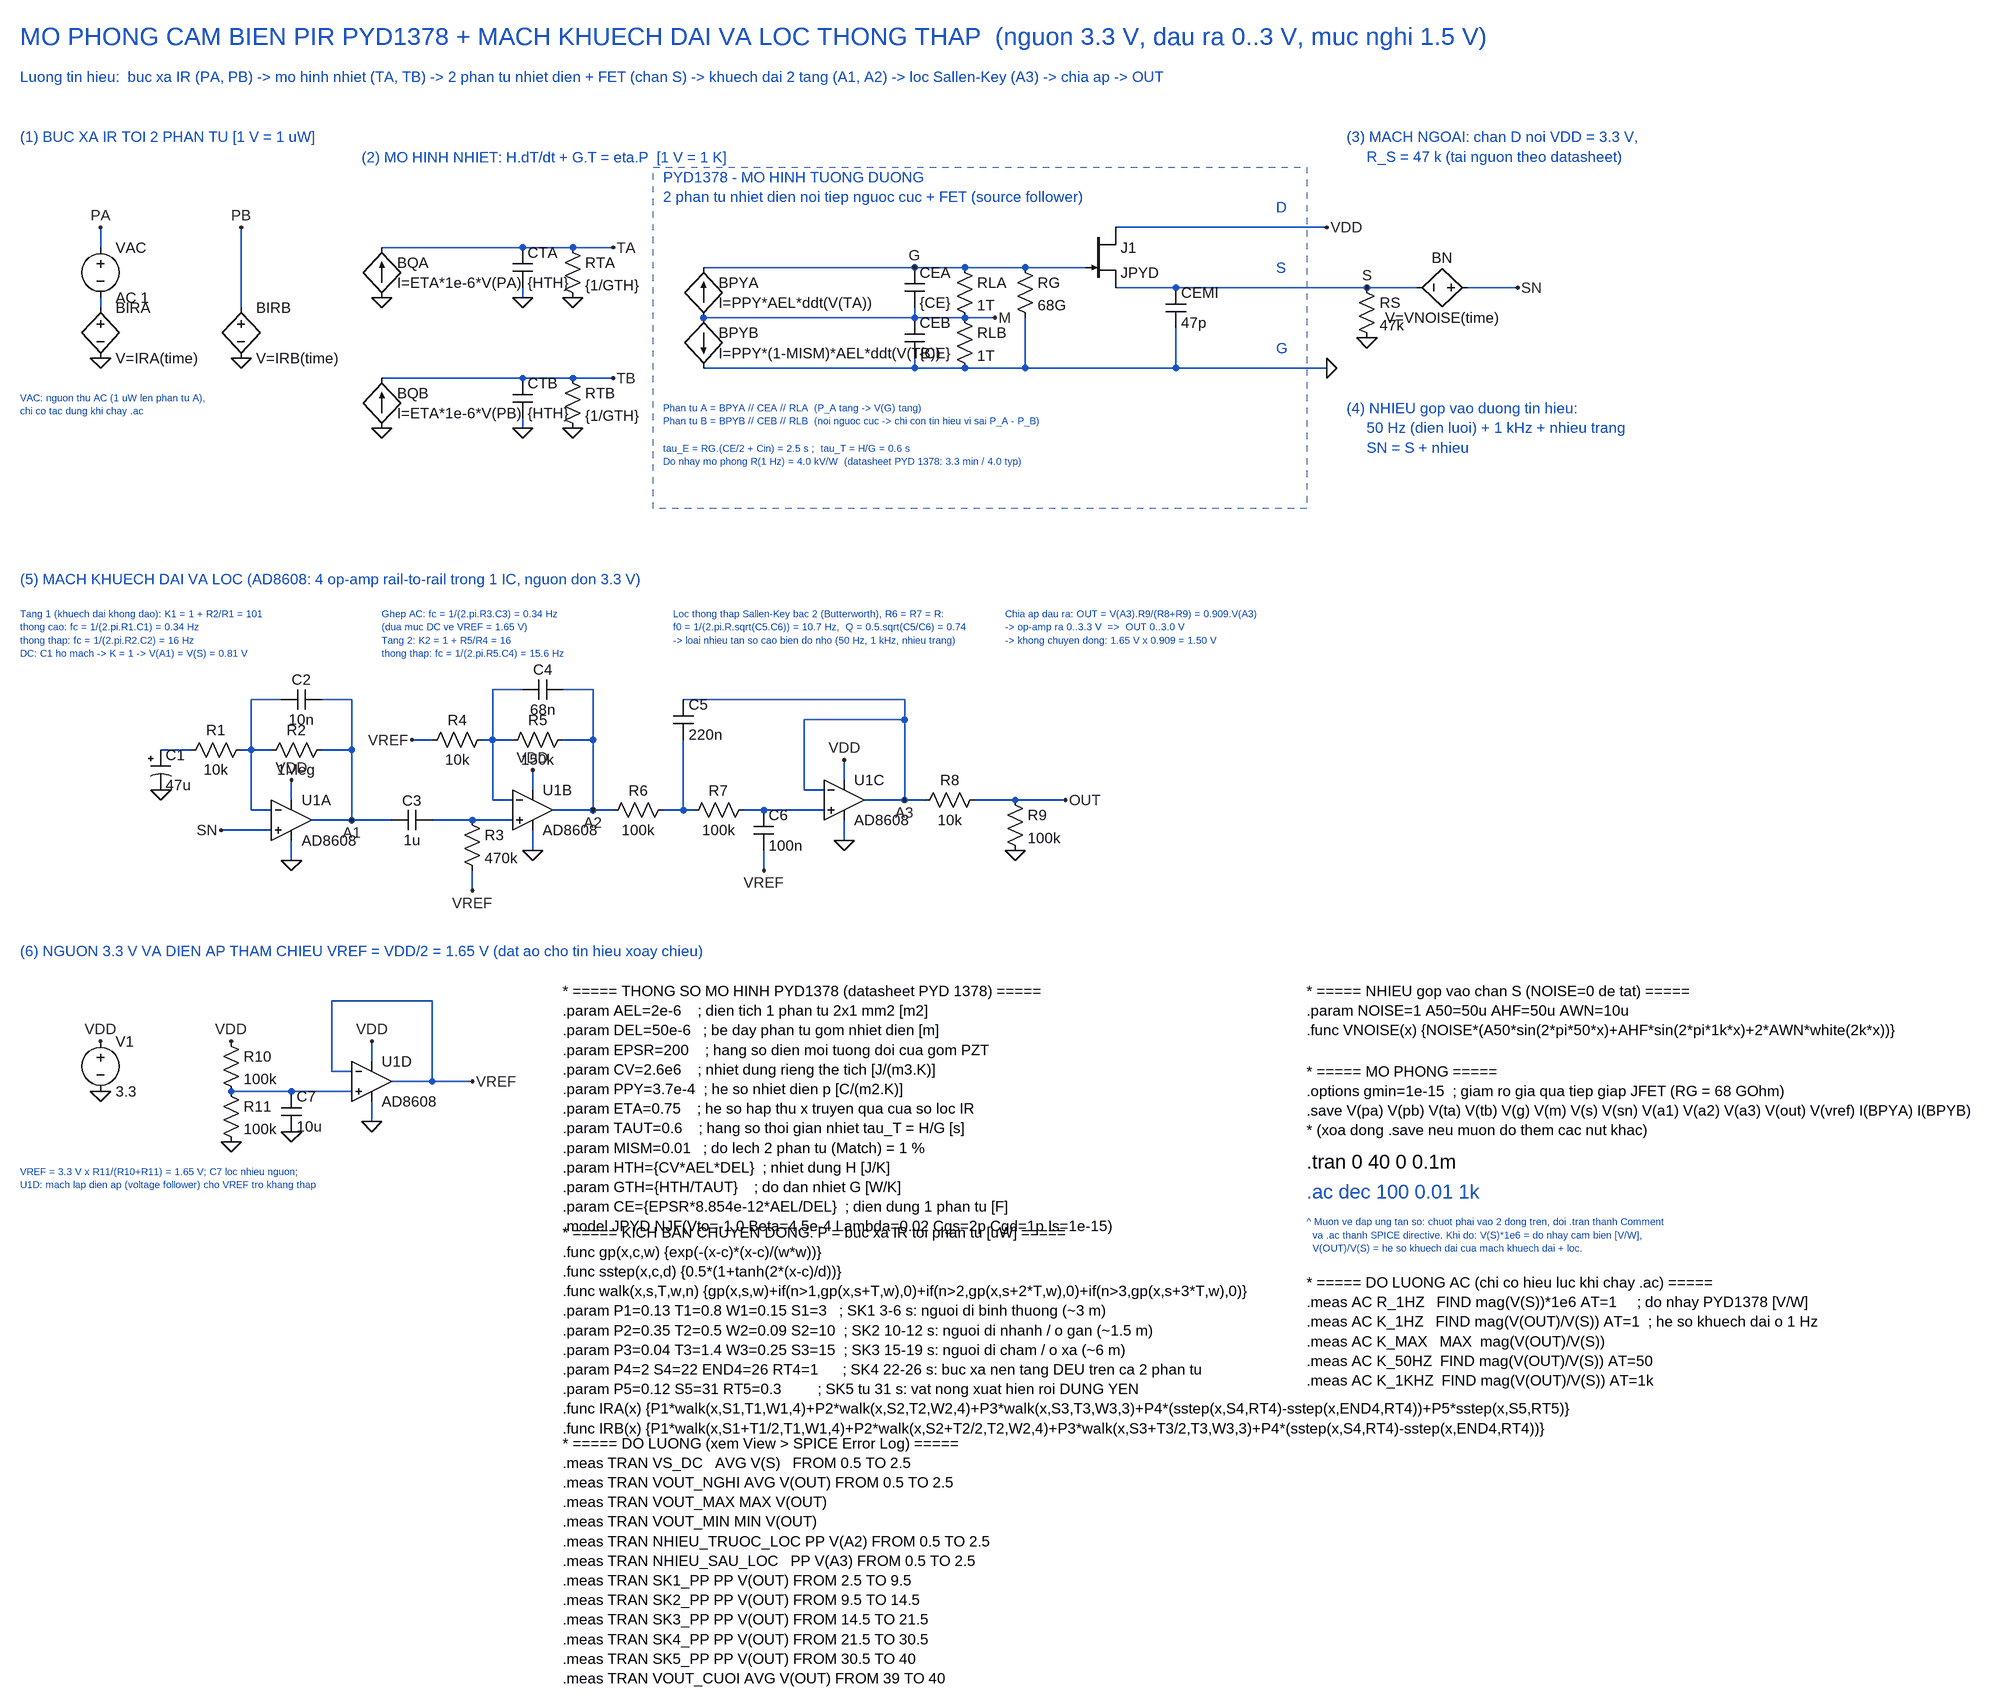
[diagram p0: schematic PIR_PYD1378.asc]
PIR_PYD1378.asc, the LTspice schematic file:
Version 4
SHEET 1 3400 2400
WIRE 96 112 96 128
WIRE 96 32 96 0
WIRE 320 128 320 0
WIRE 544 32 768 32
WIRE 768 32 848 32
WIRE 848 32 912 32
WIRE 768 96 768 112
WIRE 544 240 768 240
WIRE 768 240 848 240
WIRE 848 240 912 240
WIRE 768 304 768 320
WIRE 1056 64 1392 64
WIRE 1392 64 1472 64
WIRE 1472 64 1568 64
WIRE 1568 64 1664 64
WIRE 1392 128 1392 144
WIRE 1056 144 1392 144
WIRE 1392 144 1472 144
WIRE 1472 144 1520 144
WIRE 1392 208 1392 224
WIRE 1568 144 1568 224
WIRE 1808 160 1808 224
WIRE 1056 224 1392 224
WIRE 1392 224 1472 224
WIRE 1472 224 1568 224
WIRE 1568 224 1808 224
WIRE 1808 224 2048 224
WIRE 1712 0 2048 0
WIRE 1712 96 1808 96
WIRE 1808 96 2048 96
WIRE 2048 96 2112 96
WIRE 2112 96 2192 96
WIRE 2272 96 2352 96
WIRE 400 912 400 880
WIRE 400 976 400 1008
WIRE 368 960 288 960
WIRE 368 928 336 928
WIRE 336 928 336 832
WIRE 320 832 336 832
WIRE 336 832 368 832
WIRE 336 832 336 752
WIRE 336 752 384 752
WIRE 448 832 496 832
WIRE 448 752 496 752
WIRE 496 752 496 832
WIRE 496 832 496 944
WIRE 432 944 496 944
WIRE 240 832 192 832
WIRE 784 896 784 864
WIRE 784 960 784 992
WIRE 496 944 560 944
WIRE 624 944 688 944
WIRE 688 944 752 944
WIRE 688 1024 688 1056
WIRE 752 912 720 912
WIRE 720 912 720 816
WIRE 704 816 720 816
WIRE 720 816 752 816
WIRE 720 816 720 736
WIRE 720 736 768 736
WIRE 832 816 880 816
WIRE 832 736 880 736
WIRE 880 736 880 816
WIRE 880 816 880 928
WIRE 816 928 880 928
WIRE 624 816 592 816
WIRE 1280 880 1280 848
WIRE 1280 944 1280 976
WIRE 880 928 912 928
WIRE 992 928 1024 928
WIRE 1024 928 1040 928
WIRE 1120 928 1152 928
WIRE 1152 928 1248 928
WIRE 1024 816 1024 928
WIRE 1152 992 1152 1024
WIRE 1024 752 1376 752
WIRE 1376 752 1376 784
WIRE 1376 784 1376 912
WIRE 1248 896 1216 896
WIRE 1216 896 1216 784
WIRE 1216 784 1376 784
WIRE 1312 912 1376 912
WIRE 1376 912 1408 912
WIRE 1488 912 1552 912
WIRE 1552 912 1632 912
WIRE 304 1376 400 1376
WIRE 400 1376 496 1376
WIRE 528 1328 528 1296
WIRE 528 1392 528 1424
WIRE 496 1344 464 1344
WIRE 464 1344 464 1232
WIRE 464 1232 624 1232
WIRE 624 1232 624 1360
WIRE 560 1360 624 1360
WIRE 624 1360 688 1360
FLAG 96 0 PA
FLAG 96 208 0
FLAG 320 0 PB
FLAG 320 208 0
FLAG 912 32 TA
FLAG 544 112 0
FLAG 768 112 0
FLAG 848 112 0
FLAG 912 240 TB
FLAG 544 320 0
FLAG 768 320 0
FLAG 848 320 0
FLAG 1392 64 G
FLAG 1520 144 M
FLAG 2048 0 VDD
FLAG 2048 224 0
FLAG 2112 176 0
FLAG 2112 96 S
FLAG 2352 96 SN
FLAG 400 880 VDD
FLAG 400 1008 0
FLAG 288 960 SN
FLAG 192 896 0
FLAG 496 944 A1
FLAG 784 864 VDD
FLAG 784 992 0
FLAG 688 1056 VREF
FLAG 592 816 VREF
FLAG 880 928 A2
FLAG 1280 848 VDD
FLAG 1280 976 0
FLAG 1152 1024 VREF
FLAG 1376 912 A3
FLAG 1552 992 0
FLAG 1632 912 OUT
FLAG 96 1296 VDD
FLAG 96 1376 0
FLAG 304 1296 VDD
FLAG 304 1456 0
FLAG 400 1440 0
FLAG 528 1296 VDD
FLAG 528 1424 0
FLAG 688 1360 VREF
SYMBOL voltage 96 16 R0
SYMATTR InstName VAC
SYMATTR Value AC 1
SYMBOL bv 96 112 R0
SYMATTR InstName BIRA
SYMATTR Value V=IRA(time)
SYMBOL bv 320 112 R0
SYMATTR InstName BIRB
SYMATTR Value V=IRB(time)
SYMBOL bi2 544 32 R0
WINDOW 0 24 24 Left 2
WINDOW 3 24 56 Left 2
SYMATTR InstName BQA
SYMATTR Value I=ETA*1e-6*V(PA)
SYMBOL cap 752 32 R0
SYMATTR InstName CTA
SYMATTR Value {HTH}
SYMBOL res 832 16 R0
SYMATTR InstName RTA
SYMATTR Value {1/GTH}
SYMBOL bi2 544 240 R0
WINDOW 0 24 24 Left 2
WINDOW 3 24 56 Left 2
SYMATTR InstName BQB
SYMATTR Value I=ETA*1e-6*V(PB)
SYMBOL cap 752 240 R0
SYMATTR InstName CTB
SYMATTR Value {HTH}
SYMBOL res 832 224 R0
SYMATTR InstName RTB
SYMATTR Value {1/GTH}
SYMBOL bi2 1056 64 R0
WINDOW 0 24 24 Left 2
WINDOW 3 24 56 Left 2
SYMATTR InstName BPYA
SYMATTR Value I=PPY*AEL*ddt(V(TA))
SYMBOL bi 1056 144 R0
WINDOW 0 24 24 Left 2
WINDOW 3 24 56 Left 2
SYMATTR InstName BPYB
SYMATTR Value I=PPY*(1-MISM)*AEL*ddt(V(TB))
SYMBOL cap 1376 64 R0
SYMATTR InstName CEA
SYMATTR Value {CE}
SYMBOL cap 1376 144 R0
SYMATTR InstName CEB
SYMATTR Value {CE}
SYMBOL res 1456 48 R0
SYMATTR InstName RLA
SYMATTR Value 1T
SYMBOL res 1456 128 R0
SYMATTR InstName RLB
SYMATTR Value 1T
SYMBOL res 1552 48 R0
SYMATTR InstName RG
SYMATTR Value 68G
SYMBOL njf 1664 0 R0
SYMATTR InstName J1
SYMATTR Value JPYD
SYMBOL cap 1792 96 R0
SYMATTR InstName CEMI
SYMATTR Value 47p
SYMBOL res 2096 80 R0
SYMATTR InstName RS
SYMATTR Value 47k
SYMBOL bv 2288 96 R90
WINDOW 0 -32 56 VBottom 2
WINDOW 3 32 56 VTop 2
SYMATTR InstName BN
SYMATTR Value V=VNOISE(time)
SYMBOL OpAmps\AD8608 400 880 R0
SYMATTR InstName U1A
SYMATTR Value AD8608
SYMBOL res 464 816 R90
WINDOW 0 0 56 VBottom 2
WINDOW 3 32 56 VTop 2
SYMATTR InstName R2
SYMATTR Value 1Meg
SYMBOL cap 448 736 R90
WINDOW 0 0 32 VBottom 2
WINDOW 3 32 32 VTop 2
SYMATTR InstName C2
SYMATTR Value 10n
SYMBOL res 336 816 R90
WINDOW 0 0 56 VBottom 2
WINDOW 3 32 56 VTop 2
SYMATTR InstName R1
SYMATTR Value 10k
SYMBOL polcap 176 832 R0
SYMATTR InstName C1
SYMATTR Value 47u
SYMBOL cap 624 928 R90
WINDOW 0 0 32 VBottom 2
WINDOW 3 32 32 VTop 2
SYMATTR InstName C3
SYMATTR Value 1u
SYMBOL res 672 928 R0
SYMATTR InstName R3
SYMATTR Value 470k
SYMBOL OpAmps\AD8608 784 864 R0
SYMATTR InstName U1B
SYMATTR Value AD8608
SYMBOL res 848 800 R90
WINDOW 0 0 56 VBottom 2
WINDOW 3 32 56 VTop 2
SYMATTR InstName R5
SYMATTR Value 150k
SYMBOL cap 832 720 R90
WINDOW 0 0 32 VBottom 2
WINDOW 3 32 32 VTop 2
SYMATTR InstName C4
SYMATTR Value 68n
SYMBOL res 720 800 R90
WINDOW 0 0 56 VBottom 2
WINDOW 3 32 56 VTop 2
SYMATTR InstName R4
SYMATTR Value 10k
SYMBOL OpAmps\AD8608 1280 848 R0
SYMATTR InstName U1C
SYMATTR Value AD8608
SYMBOL res 1008 912 R90
WINDOW 0 0 56 VBottom 2
WINDOW 3 32 56 VTop 2
SYMATTR InstName R6
SYMATTR Value 100k
SYMBOL res 1136 912 R90
WINDOW 0 0 56 VBottom 2
WINDOW 3 32 56 VTop 2
SYMATTR InstName R7
SYMATTR Value 100k
SYMBOL cap 1008 752 R0
SYMATTR InstName C5
SYMATTR Value 220n
SYMBOL cap 1136 928 R0
SYMATTR InstName C6
SYMATTR Value 100n
SYMBOL res 1504 896 R90
WINDOW 0 0 56 VBottom 2
WINDOW 3 32 56 VTop 2
SYMATTR InstName R8
SYMATTR Value 10k
SYMBOL res 1536 896 R0
SYMATTR InstName R9
SYMATTR Value 100k
SYMBOL voltage 96 1280 R0
SYMATTR InstName V1
SYMATTR Value 3.3
SYMBOL res 288 1280 R0
SYMATTR InstName R10
SYMATTR Value 100k
SYMBOL res 288 1360 R0
SYMATTR InstName R11
SYMATTR Value 100k
SYMBOL cap 384 1376 R0
SYMATTR InstName C7
SYMATTR Value 10u
SYMBOL OpAmps\AD8608 528 1296 R0
SYMATTR InstName U1D
SYMATTR Value AD8608
RECTANGLE Normal 976 -96 2016 448 2
TEXT -32 -304 Left 4 ;MO PHONG CAM BIEN PIR PYD1378 + MACH KHUECH DAI VA LOC THONG THAP  (nguon 3.3 V, dau ra 0..3 V, muc nghi 1.5 V)
TEXT -32 -240 Left 2 ;Luong tin hieu:  buc xa IR (PA, PB) -> mo hinh nhiet (TA, TB) -> 2 phan tu nhiet dien + FET (chan S) -> khuech dai 2 tang (A1, A2) -> loc Sallen-Key (A3) -> chia ap -> OUT
TEXT -32 -144 Left 2 ;(1) BUC XA IR TOI 2 PHAN TU [1 V = 1 uW]
TEXT -32 272 Left 1 ;VAC: nguon thu AC (1 uW len phan tu A),\nchi co tac dung khi chay .ac
TEXT 512 -112 Left 2 ;(2) MO HINH NHIET: H.dT/dt + G.T = eta.P  [1 V = 1 K]
TEXT 992 -80 Left 2 ;PYD1378 - MO HINH TUONG DUONG\n2 phan tu nhiet dien noi tiep nguoc cuc + FET (source follower)
TEXT 1968 -32 Left 2 ;D
TEXT 1968 64 Left 2 ;S
TEXT 1968 192 Left 2 ;G
TEXT 992 288 Left 1 ;Phan tu A = BPYA // CEA // RLA  (P_A tang -> V(G) tang)\nPhan tu B = BPYB // CEB // RLB  (noi nguoc cuc -> chi con tin hieu vi sai P_A - P_B)
TEXT 992 352 Left 1 ;tau_E = RG.(CE/2 + Cin) = 2.5 s ;  tau_T = H/G = 0.6 s\nDo nhay mo phong R(1 Hz) = 4.0 kV/W  (datasheet PYD 1378: 3.3 min / 4.0 typ)
TEXT 2080 -144 Left 2 ;(3) MACH NGOAI: chan D noi VDD = 3.3 V,\n     R_S = 47 k (tai nguon theo datasheet)
TEXT 2080 288 Left 2 ;(4) NHIEU gop vao duong tin hieu:\n     50 Hz (dien luoi) + 1 kHz + nhieu trang\n     SN = S + nhieu
TEXT -32 560 Left 2 ;(5) MACH KHUECH DAI VA LOC (AD8608: 4 op-amp rail-to-rail trong 1 IC, nguon don 3.3 V)
TEXT -32 616 Left 1 ;Tang 1 (khuech dai khong dao): K1 = 1 + R2/R1 = 101\nthong cao: fc = 1/(2.pi.R1.C1) = 0.34 Hz\nthong thap: fc = 1/(2.pi.R2.C2) = 16 Hz\nDC: C1 ho mach -> K = 1 -> V(A1) = V(S) = 0.81 V
TEXT 544 616 Left 1 ;Ghep AC: fc = 1/(2.pi.R3.C3) = 0.34 Hz\n(dua muc DC ve VREF = 1.65 V)\nTang 2: K2 = 1 + R5/R4 = 16\nthong thap: fc = 1/(2.pi.R5.C4) = 15.6 Hz
TEXT 1008 616 Left 1 ;Loc thong thap Sallen-Key bac 2 (Butterworth), R6 = R7 = R:\nf0 = 1/(2.pi.R.sqrt(C5.C6)) = 10.7 Hz,  Q = 0.5.sqrt(C5/C6) = 0.74\n-> loai nhieu tan so cao bien do nho (50 Hz, 1 kHz, nhieu trang)
TEXT 1536 616 Left 1 ;Chia ap dau ra: OUT = V(A3).R9/(R8+R9) = 0.909.V(A3)\n-> op-amp ra 0..3.3 V  =>  OUT 0..3.0 V\n-> khong chuyen dong: 1.65 V x 0.909 = 1.50 V
TEXT -32 1152 Left 2 ;(6) NGUON 3.3 V VA DIEN AP THAM CHIEU VREF = VDD/2 = 1.65 V (dat ao cho tin hieu xoay chieu)
TEXT -32 1504 Left 1 ;VREF = 3.3 V x R11/(R10+R11) = 1.65 V; C7 loc nhieu nguon;\nU1D: mach lap dien ap (voltage follower) cho VREF tro khang thap
TEXT 832 1216 Left 2 !* ===== THONG SO MO HINH PYD1378 (datasheet PYD 1378) =====\n.param AEL=2e-6    ; dien tich 1 phan tu 2x1 mm2 [m2]\n.param DEL=50e-6   ; be day phan tu gom nhiet dien [m]\n.param EPSR=200    ; hang so dien moi tuong doi cua gom PZT\n.param CV=2.6e6    ; nhiet dung rieng the tich [J/(m3.K)]\n.param PPY=3.7e-4  ; he so nhiet dien p [C/(m2.K)]\n.param ETA=0.75    ; he so hap thu x truyen qua cua so loc IR\n.param TAUT=0.6    ; hang so thoi gian nhiet tau_T = H/G [s]\n.param MISM=0.01   ; do lech 2 phan tu (Match) = 1 %\n.param HTH={CV*AEL*DEL}  ; nhiet dung H [J/K]\n.param GTH={HTH/TAUT}    ; do dan nhiet G [W/K]\n.param CE={EPSR*8.854e-12*AEL/DEL}  ; dien dung 1 phan tu [F]\n.model JPYD NJF(Vto=-1.0 Beta=4.5e-4 Lambda=0.02 Cgs=2p Cgd=1p Is=1e-15)
TEXT 832 1600 Left 2 !* ===== KICH BAN CHUYEN DONG: P = buc xa IR toi phan tu [uW] =====\n.func gp(x,c,w) {exp(-(x-c)*(x-c)/(w*w))}\n.func sstep(x,c,d) {0.5*(1+tanh(2*(x-c)/d))}\n.func walk(x,s,T,w,n) {gp(x,s,w)+if(n>1,gp(x,s+T,w),0)+if(n>2,gp(x,s+2*T,w),0)+if(n>3,gp(x,s+3*T,w),0)}\n.param P1=0.13 T1=0.8 W1=0.15 S1=3   ; SK1 3-6 s: nguoi di binh thuong (~3 m)\n.param P2=0.35 T2=0.5 W2=0.09 S2=10  ; SK2 10-12 s: nguoi di nhanh / o gan (~1.5 m)\n.param P3=0.04 T3=1.4 W3=0.25 S3=15  ; SK3 15-19 s: nguoi di cham / o xa (~6 m)\n.param P4=2 S4=22 END4=26 RT4=1      ; SK4 22-26 s: buc xa nen tang DEU tren ca 2 phan tu\n.param P5=0.12 S5=31 RT5=0.3         ; SK5 tu 31 s: vat nong xuat hien roi DUNG YEN\n.func IRA(x) {P1*walk(x,S1,T1,W1,4)+P2*walk(x,S2,T2,W2,4)+P3*walk(x,S3,T3,W3,3)+P4*(sstep(x,S4,RT4)-sstep(x,END4,RT4))+P5*sstep(x,S5,RT5)}\n.func IRB(x) {P1*walk(x,S1+T1/2,T1,W1,4)+P2*walk(x,S2+T2/2,T2,W2,4)+P3*walk(x,S3+T3/2,T3,W3,3)+P4*(sstep(x,S4,RT4)-sstep(x,END4,RT4))}
TEXT 2016 1216 Left 2 !* ===== NHIEU gop vao chan S (NOISE=0 de tat) =====\n.param NOISE=1 A50=50u AHF=50u AWN=10u\n.func VNOISE(x) {NOISE*(A50*sin(2*pi*50*x)+AHF*sin(2*pi*1k*x)+2*AWN*white(2k*x))}
TEXT 2016 1344 Left 2 !* ===== MO PHONG =====\n.options gmin=1e-15  ; giam ro gia qua tiep giap JFET (RG = 68 GOhm)\n.save V(pa) V(pb) V(ta) V(tb) V(g) V(m) V(s) V(sn) V(a1) V(a2) V(a3) V(out) V(vref) I(BPYA) I(BPYB)\n* (xoa dong .save neu muon do them cac nut khac)
TEXT 2016 1488 Left 3 !.tran 0 40 0 0.1m
TEXT 2016 1536 Left 3 ;.ac dec 100 0.01 1k
TEXT 2016 1584 Left 1 ;^ Muon ve dap ung tan so: chuot phai vao 2 dong tren, doi .tran thanh Comment\n  va .ac thanh SPICE directive. Khi do: V(S)*1e6 = do nhay cam bien [V/W],\n  V(OUT)/V(S) = he so khuech dai cua mach khuech dai + loc.
TEXT 2016 1680 Left 2 !* ===== DO LUONG AC (chi co hieu luc khi chay .ac) =====\n.meas AC R_1HZ   FIND mag(V(S))*1e6 AT=1     ; do nhay PYD1378 [V/W]\n.meas AC K_1HZ   FIND mag(V(OUT)/V(S)) AT=1  ; he so khuech dai o 1 Hz\n.meas AC K_MAX   MAX  mag(V(OUT)/V(S))\n.meas AC K_50HZ  FIND mag(V(OUT)/V(S)) AT=50\n.meas AC K_1KHZ  FIND mag(V(OUT)/V(S)) AT=1k
TEXT 832 1936 Left 2 !* ===== DO LUONG (xem View > SPICE Error Log) =====\n.meas TRAN VS_DC   AVG V(S)   FROM 0.5 TO 2.5\n.meas TRAN VOUT_NGHI AVG V(OUT) FROM 0.5 TO 2.5\n.meas TRAN VOUT_MAX MAX V(OUT)\n.meas TRAN VOUT_MIN MIN V(OUT)\n.meas TRAN NHIEU_TRUOC_LOC PP V(A2) FROM 0.5 TO 2.5\n.meas TRAN NHIEU_SAU_LOC   PP V(A3) FROM 0.5 TO 2.5\n.meas TRAN SK1_PP PP V(OUT) FROM 2.5 TO 9.5\n.meas TRAN SK2_PP PP V(OUT) FROM 9.5 TO 14.5\n.meas TRAN SK3_PP PP V(OUT) FROM 14.5 TO 21.5\n.meas TRAN SK4_PP PP V(OUT) FROM 21.5 TO 30.5\n.meas TRAN SK5_PP PP V(OUT) FROM 30.5 TO 40\n.meas TRAN VOUT_CUOI AVG V(OUT) FROM 39 TO 40

The netlist it stands for:
* PIR_PYD1378.asc
VAC PA N001 AC 1
BIRA N001 0 V=IRA(time)
BIRB PB 0 V=IRB(time)
BQA 0 TA I=ETA*1e-6*V(PA)
CTA TA 0 {HTH}
RTA TA 0 {1/GTH}
BQB 0 TB I=ETA*1e-6*V(PB)
CTB TB 0 {HTH}
RTB TB 0 {1/GTH}
BPYA M G I=PPY*AEL*ddt(V(TA))
BPYB M 0 I=PPY*(1-MISM)*AEL*ddt(V(TB))
CEA G M {CE}
CEB M 0 {CE}
RLA G M 1T
RLB M 0 1T
RG G 0 68G
J1 VDD G S JPYD
CEMI S 0 47p
RS S 0 47k
BN SN S V=VNOISE(time)
XU1A SN N002 VDD 0 A1 AD8608  ; pins In+ In- V+ V- OUT
R2 A1 N002 1Meg
C2 A1 N002 10n
R1 N002 N003 10k
C1 N003 0 47u
C3 N004 A1 1u
R3 N004 VREF 470k
XU1B N004 N005 VDD 0 A2 AD8608  ; pins In+ In- V+ V- OUT
R5 A2 N005 150k
C4 A2 N005 68n
R4 N005 VREF 10k
XU1C N007 A3 VDD 0 A3 AD8608  ; pins In+ In- V+ V- OUT
R6 N006 A2 100k
R7 N007 N006 100k
C5 A3 N006 220n
C6 N007 VREF 100n
R8 OUT A3 10k
R9 OUT 0 100k
V1 VDD 0 3.3
R10 VDD N008 100k
R11 N008 0 100k
C7 N008 0 10u
XU1D N008 VREF VDD 0 VREF AD8608  ; pins In+ In- V+ V- OUT
.model NJF NJF
.model PJF PJF
.lib standard.jft
* MO PHONG CAM BIEN PIR PYD1378 + MACH KHUECH DAI VA LOC THONG THAP  (nguon 3.3 V, dau ra 0..3 V, muc nghi 1.5 V)
* Luong tin hieu:  buc xa IR (PA, PB) -> mo hinh nhiet (TA, TB) -> 2 phan tu nhiet dien + FET (chan S) -> khuech dai 2 tang (A1, A2) -> loc Sallen-Key (A3) -> chia ap -> OUT
* (1) BUC XA IR TOI 2 PHAN TU [1 V = 1 uW]
* VAC: nguon thu AC (1 uW len phan tu A),
* chi co tac dung khi chay .ac
* (2) MO HINH NHIET: H.dT/dt + G.T = eta.P  [1 V = 1 K]
* PYD1378 - MO HINH TUONG DUONG
* 2 phan tu nhiet dien noi tiep nguoc cuc + FET (source follower)
* D
* S
* G
* Phan tu A = BPYA // CEA // RLA  (P_A tang -> V(G) tang)
* Phan tu B = BPYB // CEB // RLB  (noi nguoc cuc -> chi con tin hieu vi sai P_A - P_B)
* tau_E = RG.(CE/2 + Cin) = 2.5 s ;  tau_T = H/G = 0.6 s
* Do nhay mo phong R(1 Hz) = 4.0 kV/W  (datasheet PYD 1378: 3.3 min / 4.0 typ)
* (3) MACH NGOAI: chan D noi VDD = 3.3 V,
*      R_S = 47 k (tai nguon theo datasheet)
* (4) NHIEU gop vao duong tin hieu:
*      50 Hz (dien luoi) + 1 kHz + nhieu trang
*      SN = S + nhieu
* (5) MACH KHUECH DAI VA LOC (AD8608: 4 op-amp rail-to-rail trong 1 IC, nguon don 3.3 V)
* Tang 1 (khuech dai khong dao): K1 = 1 + R2/R1 = 101
* thong cao: fc = 1/(2.pi.R1.C1) = 0.34 Hz
* thong thap: fc = 1/(2.pi.R2.C2) = 16 Hz
* DC: C1 ho mach -> K = 1 -> V(A1) = V(S) = 0.81 V
* Ghep AC: fc = 1/(2.pi.R3.C3) = 0.34 Hz
* (dua muc DC ve VREF = 1.65 V)
* Tang 2: K2 = 1 + R5/R4 = 16
* thong thap: fc = 1/(2.pi.R5.C4) = 15.6 Hz
* Loc thong thap Sallen-Key bac 2 (Butterworth), R6 = R7 = R:
* f0 = 1/(2.pi.R.sqrt(C5.C6)) = 10.7 Hz,  Q = 0.5.sqrt(C5/C6) = 0.74
* -> loai nhieu tan so cao bien do nho (50 Hz, 1 kHz, nhieu trang)
* Chia ap dau ra: OUT = V(A3).R9/(R8+R9) = 0.909.V(A3)
* -> op-amp ra 0..3.3 V  =>  OUT 0..3.0 V
* -> khong chuyen dong: 1.65 V x 0.909 = 1.50 V
* (6) NGUON 3.3 V VA DIEN AP THAM CHIEU VREF = VDD/2 = 1.65 V (dat ao cho tin hieu xoay chieu)
* VREF = 3.3 V x R11/(R10+R11) = 1.65 V; C7 loc nhieu nguon;
* U1D: mach lap dien ap (voltage follower) cho VREF tro khang thap
* ===== THONG SO MO HINH PYD1378 (datasheet PYD 1378) =====
.param AEL=2e-6    ; dien tich 1 phan tu 2x1 mm2 [m2]
.param DEL=50e-6   ; be day phan tu gom nhiet dien [m]
.param EPSR=200    ; hang so dien moi tuong doi cua gom PZT
.param CV=2.6e6    ; nhiet dung rieng the tich [J/(m3.K)]
.param PPY=3.7e-4  ; he so nhiet dien p [C/(m2.K)]
.param ETA=0.75    ; he so hap thu x truyen qua cua so loc IR
.param TAUT=0.6    ; hang so thoi gian nhiet tau_T = H/G [s]
.param MISM=0.01   ; do lech 2 phan tu (Match) = 1 %
.param HTH={CV*AEL*DEL}  ; nhiet dung H [J/K]
.param GTH={HTH/TAUT}    ; do dan nhiet G [W/K]
.param CE={EPSR*8.854e-12*AEL/DEL}  ; dien dung 1 phan tu [F]
.model JPYD NJF(Vto=-1.0 Beta=4.5e-4 Lambda=0.02 Cgs=2p Cgd=1p Is=1e-15)
* ===== KICH BAN CHUYEN DONG: P = buc xa IR toi phan tu [uW] =====
.func gp(x,c,w) {exp(-(x-c)*(x-c)/(w*w))}
.func sstep(x,c,d) {0.5*(1+tanh(2*(x-c)/d))}
.func walk(x,s,T,w,n) {gp(x,s,w)+if(n>1,gp(x,s+T,w),0)+if(n>2,gp(x,s+2*T,w),0)+if(n>3,gp(x,s+3*T,w),0)}
.param P1=0.13 T1=0.8 W1=0.15 S1=3   ; SK1 3-6 s: nguoi di binh thuong (~3 m)
.param P2=0.35 T2=0.5 W2=0.09 S2=10  ; SK2 10-12 s: nguoi di nhanh / o gan (~1.5 m)
.param P3=0.04 T3=1.4 W3=0.25 S3=15  ; SK3 15-19 s: nguoi di cham / o xa (~6 m)
.param P4=2 S4=22 END4=26 RT4=1      ; SK4 22-26 s: buc xa nen tang DEU tren ca 2 phan tu
.param P5=0.12 S5=31 RT5=0.3         ; SK5 tu 31 s: vat nong xuat hien roi DUNG YEN
.func IRA(x) {P1*walk(x,S1,T1,W1,4)+P2*walk(x,S2,T2,W2,4)+P3*walk(x,S3,T3,W3,3)+P4*(sstep(x,S4,RT4)-sstep(x,END4,RT4))+P5*sstep(x,S5,RT5)}
.func IRB(x) {P1*walk(x,S1+T1/2,T1,W1,4)+P2*walk(x,S2+T2/2,T2,W2,4)+P3*walk(x,S3+T3/2,T3,W3,3)+P4*(sstep(x,S4,RT4)-sstep(x,END4,RT4))}
* ===== NHIEU gop vao chan S (NOISE=0 de tat) =====
.param NOISE=1 A50=50u AHF=50u AWN=10u
.func VNOISE(x) {NOISE*(A50*sin(2*pi*50*x)+AHF*sin(2*pi*1k*x)+2*AWN*white(2k*x))}
* ===== MO PHONG =====
.options gmin=1e-15  ; giam ro gia qua tiep giap JFET (RG = 68 GOhm)
.save V(pa) V(pb) V(ta) V(tb) V(g) V(m) V(s) V(sn) V(a1) V(a2) V(a3) V(out) V(vref) I(BPYA) I(BPYB)
* (xoa dong .save neu muon do them cac nut khac)
.tran 0 40 0 0.1m
* .ac dec 100 0.01 1k
* ^ Muon ve dap ung tan so: chuot phai vao 2 dong tren, doi .tran thanh Comment
*   va .ac thanh SPICE directive. Khi do: V(S)*1e6 = do nhay cam bien [V/W],
*   V(OUT)/V(S) = he so khuech dai cua mach khuech dai + loc.
* ===== DO LUONG AC (chi co hieu luc khi chay .ac) =====
.meas AC R_1HZ   FIND mag(V(S))*1e6 AT=1     ; do nhay PYD1378 [V/W]
.meas AC K_1HZ   FIND mag(V(OUT)/V(S)) AT=1  ; he so khuech dai o 1 Hz
.meas AC K_MAX   MAX  mag(V(OUT)/V(S))
.meas AC K_50HZ  FIND mag(V(OUT)/V(S)) AT=50
.meas AC K_1KHZ  FIND mag(V(OUT)/V(S)) AT=1k
* ===== DO LUONG (xem View > SPICE Error Log) =====
.meas TRAN VS_DC   AVG V(S)   FROM 0.5 TO 2.5
.meas TRAN VOUT_NGHI AVG V(OUT) FROM 0.5 TO 2.5
.meas TRAN VOUT_MAX MAX V(OUT)
.meas TRAN VOUT_MIN MIN V(OUT)
.meas TRAN NHIEU_TRUOC_LOC PP V(A2) FROM 0.5 TO 2.5
.meas TRAN NHIEU_SAU_LOC   PP V(A3) FROM 0.5 TO 2.5
.meas TRAN SK1_PP PP V(OUT) FROM 2.5 TO 9.5
.meas TRAN SK2_PP PP V(OUT) FROM 9.5 TO 14.5
.meas TRAN SK3_PP PP V(OUT) FROM 14.5 TO 21.5
.meas TRAN SK4_PP PP V(OUT) FROM 21.5 TO 30.5
.meas TRAN SK5_PP PP V(OUT) FROM 30.5 TO 40
.meas TRAN VOUT_CUOI AVG V(OUT) FROM 39 TO 40
.backanno
.end